# Altium project Ibrahim_Main_Board.PrjPcb (part 1 of 2)
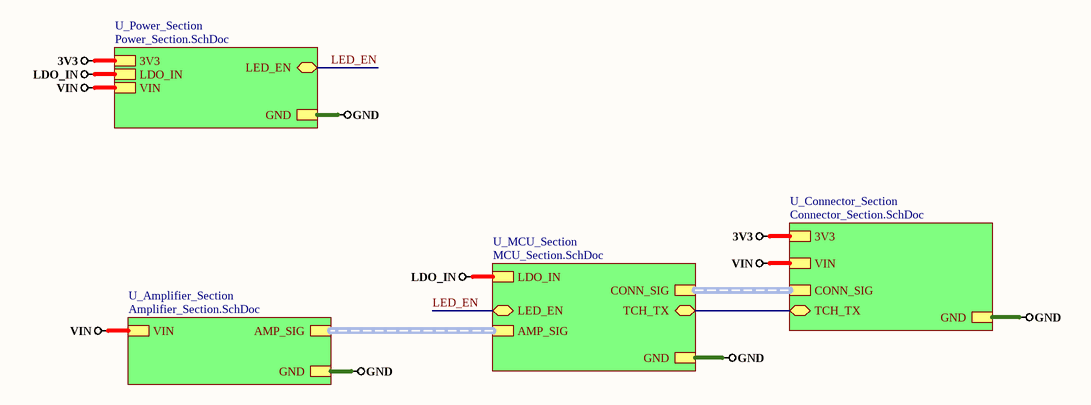
[diagram p0: Top_Sheet.SchDoc]
7 sheets, 83 parts. Net scope: hierarchical (ports join the sheet entries above them; power ports are global).
Board file: Main_PCB.PcbDoc
Sheets:
  Top_Sheet.SchDoc
    U_MCU_Section = MCU_Section.SchDoc
    U_Connector_Section = Connector_Section.SchDoc
    U_Amplifier_Section = Amplifier_Section.SchDoc
    U_Power_Section = Power_Section.SchDoc
      U_MCU_Power_Sheet = MCU_Power_Sheet.SchDoc
      U_LED_Power_Sheet = LED_Power_Sheet.SchDoc

## Sheet Top_Sheet.SchDoc
size A4

### Sub-sheets
U_Amplifier_Section = Amplifier_Section.SchDoc: AMP_SIG (harness AMP_SIG), VIN, GND
U_Connector_Section = Connector_Section.SchDoc: CONN_SIG (harness CONN_SIG), 3V3, GND, VIN, TCH_TX (bidir)
U_MCU_Section = MCU_Section.SchDoc: AMP_SIG (harness AMP_SIG), CONN_SIG (harness CONN_SIG), GND, LDO_IN, LED_EN (bidir), TCH_TX (bidir)
U_Power_Section = Power_Section.SchDoc: 3V3, GND, LDO_IN, VIN, LED_EN (bidir)

### Nets
3V3: sheet U_Connector_Section/3V3, sheet U_Power_Section/3V3
GND: sheet U_MCU_Section/GND, sheet U_Connector_Section/GND, sheet U_Amplifier_Section/GND, sheet U_Power_Section/GND
LDO_IN: sheet U_MCU_Section/LDO_IN, sheet U_Power_Section/LDO_IN
VIN: sheet U_Connector_Section/VIN, sheet U_Amplifier_Section/VIN, sheet U_Power_Section/VIN
LED_EN: sheet U_MCU_Section/LED_EN, sheet U_Power_Section/LED_EN
TCH_TX: sheet U_MCU_Section/TCH_TX, sheet U_Connector_Section/TCH_TX

### Buses and harness runs
harness sheet U_Amplifier_Section/AMP_SIG = sheet U_MCU_Section/AMP_SIG
harness sheet U_Connector_Section/CONN_SIG = sheet U_MCU_Section/CONN_SIG

## Sheet MCU_Section.SchDoc
size A4
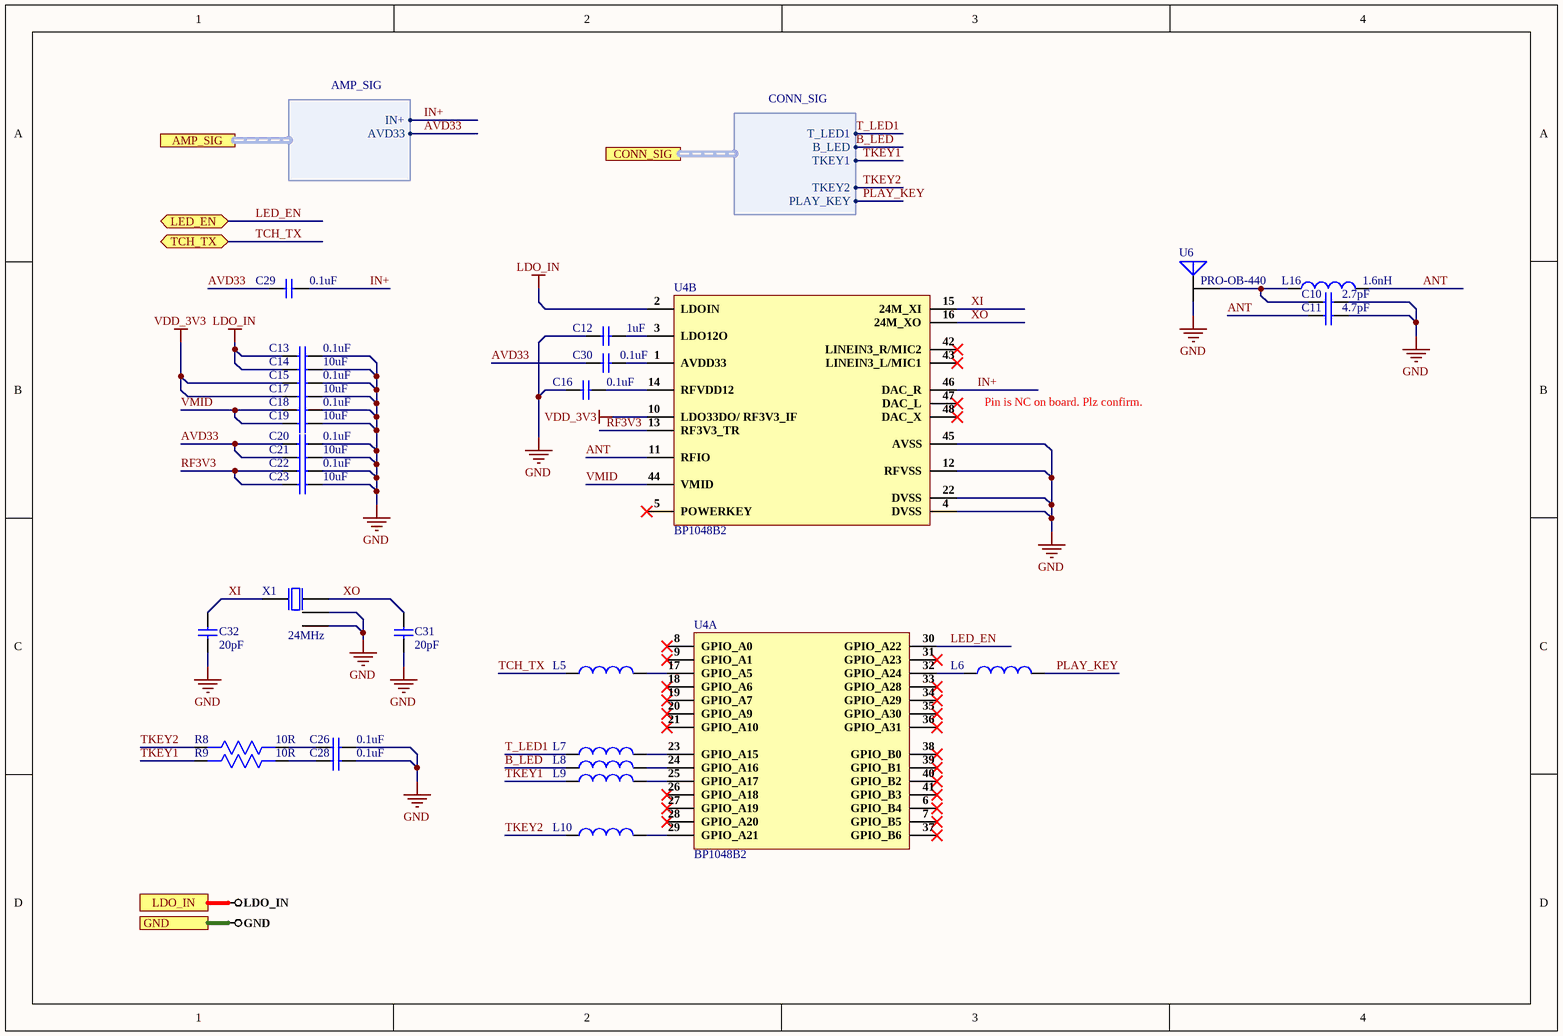
[diagram p1: MCU_Section.SchDoc]

### Parts
C10  2.7pF  [Cap0402]
C11  4.7pF  [Cap0402]
C12  1uF  [Cap0603]
C13  0.1uF  [Cap0805]
C14  10uF  [Cap0603]
C15  0.1uF  [Cap0805]
C16  0.1uF  [Cap0805]
C17  10uF  [Cap0603]
C18  0.1uF  [Cap0805]
C19  10uF  [Cap0603]
C20  0.1uF  [Cap0805]
C21  10uF  [Cap0603]
C22  0.1uF  [Cap0805]
C23  10uF  [Cap0603]
C26  0.1uF  [Cap0805]
C28  0.1uF  [Cap0805]
C29  0.1uF  [Cap0805]
C30  0.1uF  [Cap0805]
C31  20pF  [Cap0805]
C32  20pF  [Cap0805]
L5  BLM18AG121SN1D  [BLM18AG121SN1D]  (value not drawn)
L6  BLM18AG121SN1D  [BLM18AG121SN1D]  (value not drawn)
L7  BLM18AG121SN1D  [BLM18AG121SN1D]  (value not drawn)
L8  BLM18AG121SN1D  [BLM18AG121SN1D]  (value not drawn)
L9  BLM18AG121SN1D  [BLM18AG121SN1D]  (value not drawn)
L10  BLM18AG121SN1D  [BLM18AG121SN1D]  (value not drawn)
L16  1.6nH  [Ind 0402]
R8  10R  [Res0603]
R9  10R  [Res0603]
U4  BP1048B2  [48 LQFP]  (parts A,B of 2)
U6  PRO-OB-440  [PRO-OB-440]
X1  24MHz  [7I24000F20UCG]

### Ports
AMP_SIG (harness AMP_SIG), CONN_SIG (harness CONN_SIG), GND, LDO_IN, LED_EN (bidir), TCH_TX (bidir)

### Harnesses
AMP_SIG: IN+, AVD33
CONN_SIG: T_LED1, B_LED, TKEY1, TKEY2, PLAY_KEY

### Nets
GND: C10.2 C11.2 C12.1 C13.2 C14.2 C15.2 C16.1 C17.2 C18.2 C19.2 C20.2 C21.2 C22.2 C23.2 C26.2 C28.2 C31.1 C32.1 U4.4(DVSS) U4.12(RFVSS) U4.22(DVSS) U4.45(AVSS) U6.1(A) X1.2(GND) X1.4(GND) ; port GND
LDO_IN: C13.1 C14.1 U4.2(LDOIN) ; port LDO_IN
VDD_3V3: C15.1 C17.1 U4.10(LDO33DO/_RF3V3_IF)
ANT: C11.1 L16.2 U4.11(RFIO)
AVD33: C20.1 C21.1 C29.1 C30.1 ; port AMP_SIG.AVD33
B_LED: L8.1 ; port CONN_SIG.B_LED
IN+: C29.2 U4.46(DAC_R) ; port AMP_SIG.IN+
LED_EN: U4.30(GPIO_A22) ; port LED_EN
PLAY_KEY: L6.2 ; port CONN_SIG.PLAY_KEY
RF3V3: C22.1 C23.1 U4.13(RF3V3_TR)
T_LED1: L7.1 ; port CONN_SIG.T_LED1
TCH_TX: L5.1 ; port TCH_TX
TKEY1: L9.1 R9.2 ; port CONN_SIG.TKEY1
TKEY2: L10.1 R8.2 ; port CONN_SIG.TKEY2
VMID: C18.1 C19.1 U4.44(VMID)
XI: C32.2 U4.15(24M_XI) X1.1(inp)
XO: C31.2 U4.16(24M_XO) X1.3(out)
NetC10_1: C10.1 L16.1 U6.2(A)
NetC12_2: C12.2 U4.3(LDO12O)
NetC16_2: C16.2 U4.14(RFVDD12)
NetC26_1: C26.1 R8.1
NetC28_1: C28.1 R9.1
NetC30_2: C30.2 U4.1(AVDD33)
NetL5_2: L5.2 U4.17(GPIO_A5)
NetL6_1: L6.1 U4.32(GPIO_A24)
NetL7_2: L7.2 U4.23(GPIO_A15)
NetL8_2: L8.2 U4.24(GPIO_A16)
NetL9_2: L9.2 U4.25(GPIO_A17)
NetL10_2: L10.2 U4.29(GPIO_A21)

Not connected (* = marked no-connect by the designer): U4 5(POWERKEY)* 6(GPIO_B4)* 7(GPIO_B5)* 8(GPIO_A0)* 9(GPIO_A1)* 18(GPIO_A6)* 19(GPIO_A7)* 20(GPIO_A9)* 21(GPIO_A10)* 26(GPIO_A18)* 27(GPIO_A19)* 28(GPIO_A20)* 31(GPIO_A23)* 33(GPIO_A28)* 34(GPIO_A29)* 35(GPIO_A30)* 36(GPIO_A31)* 37(GPIO_B6)* 38(GPIO_B0)* 39(GPIO_B1)* 40(GPIO_B2)* 41(GPIO_B3)* 42(LINEIN3_R/MIC2)* 43(LINEIN3_L/MIC1)* 47(DAC_L)* 48(DAC_X)*; U6 3(A) 4(A)

### Notes on the sheet
- Pin is NC on board. Plz confirm.

### Library data of the parts
C10 = 04023A2R7BAT2A: CAP CER 2.7PF 25V NP0 0402; Manufacturer: Kyocera AVX; Dielectric: C0G; Temperature Coefficient: 0ppm/°C; Supplier 1: Digi-Key; Manufacturer Part Number: 04023A2R7BAT2A; Stock 1: 28479; Pricing 1: 1=0.32, 10=0.218, 50=0.1452, 100=0.1234, 500=0.08712, 1000=0.07623, 2500=0.0726, 5000=0.06716 (USD); Mount: Surface Mount; Case/Package: 0402; Case Code (Metric): 1005; Case Code (Imperial): 0402; Min Operating Temperature: -55°C; Max Operating Temperature: 125°C; Package Quantity: 10000; Capacitance: 2.7pF; Voltage Rating: 25V; Packaging: Tape and Reel; Voltage Rating (DC): 25V; Termination: SMD/SMT; Length: 1mm; Width: 0.02inch; Thickness: 0.022inch; Depth: 0.5mm; Radiation Hardening: No; Lead Free: Lead Free; ComponentLink1URL: http://datasheets.avx.com/C0GNP0-Dielectric.pdf?src-supplier=Digi-Key; ComponentLink1Description: http://datasheets.avx.com/C0GNP0-Dielectric.pdf?src-supplier=Digi-Key; ComponentLink2URL: http://www.avx.com/docs/Catalogs/ccog.pdf?src-supplier=Future+Electronics; ComponentLink2Description: http://www.avx.com/docs/Catalogs/ccog.pdf?src-supplier=Future+Electronics; ComponentLink3URL: http://www.avxcorp.com/docs/Catalogs/ccog.pdf?src-supplier=Avnet; ComponentLink3Description: http://www.avxcorp.com/docs/Catalogs/ccog.pdf?src-supplier=Avnet; Supplier Part Number 1: 478-12612-6-ND
C11 = 885012005023: CAP CER 4.7PF 16V C0G/NP0 0402; Manufacturer: Wurth Electronics; Supplier 1: Digi-Key; Manufacturer Part Number: 885012005023; Stock 1: 8921; Pricing 1: 1=0.1, 10=0.015, 100=0.0134, 500=0.01188 (USD); Mount: Surface Mount; Case/Package: 0402; Case Code (Metric): 1005; Case Code (Imperial): 0402; Min Operating Temperature: -55°C; Max Operating Temperature: 125°C; Packaging: Cut Tape; Capacitance: 4.7pF; Voltage Rating: 16V; Length: 0.039inch; Width: 0.02inch; Thickness: 0.022inch; ComponentLink1URL: https://katalog.we-online.de/pbs/datasheet/885012005023.pdf?src-supplier=Digi-Key; ComponentLink1Description: https://katalog.we-online.de/pbs/datasheet/885012005023.pdf?src-supplier=Digi-Key; ComponentLink2URL: http://www.farnell.com/datasheets/2546554.pdf?src-supplier=Farnell; ComponentLink2Description: http://www.farnell.com/datasheets/2546554.pdf?src-supplier=Farnell; ComponentLink3URL: http://www.farnell.com/datasheets/2546554.pdf?src-supplier=Newark; ComponentLink3Description: http://www.farnell.com/datasheets/2546554.pdf?src-supplier=Newark; ComponentLink4URL: http://www.farnell.com/datasheets/2546554.pdf?src-supplier=Element14; ComponentLink4Description: http://www.farnell.com/datasheets/2546554.pdf?src-supplier=Element14; Supplier Part Number 1: 732-7439-6-ND
C12 = CC0603KRX5R8BB105: CAP CER 1UF 25V X5R 0603; Manufacturer: Yageo; Tolerance: 10%; Supplier 1: Digi-Key; Manufacturer Part Number: CC0603KRX5R8BB105; RoHS: Yes; Category: Ceramic Capacitors; Stock 1: 919939; Pricing 1: 1=0.12000, 10=0.08400, 50=0.04760, 100=0.03940, 500=0.02764, 1000=0.02288 (USD); Mount: Surface Mount; Case/Package: 0603; Number of Pins: 2; Case Code (Metric): 1608; Case Code (Imperial): 0603; Min Operating Temperature: -55°C; Max Operating Temperature: 85°C; Capacitance: 1uF; Dielectric: X5R; Package Quantity: 1; Voltage Rating: 25V; Packaging: Tape and Reel; Termination: SMD/SMT; Voltage Rating (DC): 25V; Series: CC; Construction: Flat; Length: 1.6mm; Width: 0.031inch; Height: 0.8mm; Thickness: 0.035inch; Depth: 0.8mm; Radiation Hardening: No; REACH SVHC: No SVHC; Lead Free: Lead Free; Halogen Free: Halogen Free; RoHS Compliant: Yes; ComponentLink1URL: https://datasheet.ciiva.com/176/mlccorderingcode-176785.pdf?src-supplier=Digi-Key; ComponentLink1Description: https://datasheet.ciiva.com/176/mlccorderingcode-176785.pdf?src-supplier=Digi-Key; ComponentLink2URL: https://datasheet.ciiva.com/176/mlccorderingcode-176786.pdf?src-supplier=Digi-Key; ComponentLink2Description: https://datasheet.ciiva.com/176/mlccorderingcode-176786.pdf?src-supplier=Digi-Key; ComponentLink3URL: https://datasheet.ciiva.com/176/mlccorderingcode-176787.pdf?src-supplier=Digi-Key; ComponentLink3Description: https://datasheet.ciiva.com/176/mlccorderingcode-176787.pdf?src-supplier=Digi-Key; ComponentLink4URL: https://datasheet.ciiva.com/17436/upy-gphc-x5r-4v-to-50v-12-17436952.pdf?src-supplier=Avnet+Europe; ComponentLink4Description: https://datasheet.ciiva.com/17436/upy-gphc-x5r-4v-to-50v-12-17436952.pdf?src-supplier=Avnet+Europe; ComponentLink5URL: https://datasheet.ciiva.com/7978/1525783-7978171.pdf?src-supplier=Element14; ComponentLink5Description: https://datasheet.ciiva.com/7978/1525783-7978171.pdf?src-supplier=Element14; ComponentLink6URL: https://datasheet.ciiva.com/11586/upy-gphc-x5r-4v-to-50v-12-11586318.pdf?src-supplier=Avnet; ComponentLink6Description: https://datasheet.ciiva.com/11586/upy-gphc-x5r-4v-to-50v-12-11586318.pdf?src-supplier=Avnet; Supplier Part Number 1: 311-1445-1-ND
C13 C15 C16 C18 C20 C22 C26 C28-C30 = 0805B104K500CT: CAP CER 0.1UF 50V X7R 0805; Manufacturer: Walsin Technologies; Tolerance: 10%; Capacitance: 100nF; Supplier 1: Digi-Key; Manufacturer Part Number: 0805B104K500CT; RoHS: Yes; Category: Ceramic Capacitors; Stock 1: 1274242; Pricing 1: 1=0.12000, 10=0.08600, 50=0.04900, 100=0.04050, 500=0.02842, 1000=0.02352 (USD); Case/Package: 0805; Case Code (Imperial): 0805; Case Code (Metric): 2012; Min Operating Temperature: -55°C; Max Operating Temperature: 125°C; Packaging: Tape and Reel; Voltage Rating: 50V; Dielectric: X7R; Voltage Rating (DC): 50V; Voltage: 50V; Length: 2mm; Depth: 1.25mm; Radiation Hardening: No; REACH SVHC: Unknown; Lead Free: Lead Free; ComponentLink1URL: http://www.farnell.com/datasheets/2340522.pdf?src-supplier=Farnell; ComponentLink1Description: http://www.farnell.com/datasheets/2340522.pdf?src-supplier=Farnell; ComponentLink2URL: http://components.arrow.com/part/dataview/0323_00650840?src-supplier=Arrow+Europe; ComponentLink2Description: http://components.arrow.com/part/dataview/0323_00650840?src-supplier=Arrow+Europe; ComponentLink3URL: https://www.verical.com/server-webapp/html/getDatasheet?partID=414849&src-supplier=Verical; ComponentLink3Description: https://www.verical.com/server-webapp/html/getDatasheet?partID=414849&src-supplier=Verical; ComponentLink4URL: http://www.farnell.com/datasheets/2340522.pdf?src-supplier=Element14; ComponentLink4Description: http://www.farnell.com/datasheets/2340522.pdf?src-supplier=Element14; ComponentLink5URL: http://www.passivecomponent.com/wp-content/uploads/2018/10/MLCC.pdf?src-supplier=Digi-Key; ComponentLink5Description: http://www.passivecomponent.com/wp-content/uploads/2018/10/MLCC.pdf?src-supplier=Digi-Key; ComponentLink6URL: http://www.passivecomponent.com/indexsea/0805B104K500CT-IB.pdf?src-supplier=Digi-Key; ComponentLink6Description: http://www.passivecomponent.com/indexsea/0805B104K500CT-IB.pdf?src-supplier=Digi-Key; ComponentLink7URL: http://www.farnell.com/datasheets/2340522.pdf?src-supplier=Newark; ComponentLink7Description: http://www.farnell.com/datasheets/2340522.pdf?src-supplier=Newark; Supplier Part Number 1: 1292-1647-1-ND
C14 C17 C19 C21 C23 = C1608X5R1E106M080AC: CAP CER 10UF 25V X5R 0603; Manufacturer: TDK; Dielectric Material: Ceramic; Tolerance: 20%; Supplier 1: Digi-Key; Manufacturer Part Number: C1608X5R1E106M080AC; RoHS: Yes; Category: Ceramic Capacitors; Stock 1: 217631; Pricing 1: 1=0.86000, 10=0.60700, 50=0.45920, 100=0.39990, 500=0.29624, 1000=0.25180 (USD); Mount: Surface Mount; Case/Package: 0603; Case Code (Imperial): 0603; Case Code (Metric): 1608; Weight: 7.1E-05oz; Min Operating Temperature: -55°C; Max Operating Temperature: 85°C; Capacitance: 10uF; Packaging: Tape and Reel; Voltage Rating: 25V; Voltage Rating (DC): 25V; Termination: SMD/SMT; Series: C; Package Quantity: 1; Dielectric: X5R; Resistor Type: Ceramic; Construction: Flat; Length: 1.6mm; Width: 0.8mm; Height: 0.8mm; Thickness: 0.039inch; Depth: 0.8mm; Lead Free: Lead Free; REACH SVHC: No SVHC; RoHS Compliant: Yes; ComponentLink1URL: http://components.arrow.com/part/dataview/0323_06887183?src-supplier=Arrow+Europe; ComponentLink1Description: http://components.arrow.com/part/dataview/0323_06887183?src-supplier=Arrow+Europe; ComponentLink2URL: http://www.farnell.com/datasheets/2792994.pdf?src-supplier=Farnell; ComponentLink2Description: http://www.farnell.com/datasheets/2792994.pdf?src-supplier=Farnell; ComponentLink3URL: http://www.farnell.com/datasheets/2291921.pdf?src-supplier=Avnet; ComponentLink3Description: http://www.farnell.com/datasheets/2291921.pdf?src-supplier=Avnet; ComponentLink4URL: http://www.farnell.com/datasheets/1470445.pdf?src-supplier=Newark; ComponentLink4Description: http://www.farnell.com/datasheets/1470445.pdf?src-supplier=Newark; ComponentLink5URL: http://www.farnell.com/datasheets/2291921.pdf?src-supplier=Newark; ComponentLink5Description: http://www.farnell.com/datasheets/2291921.pdf?src-supplier=Newark; ComponentLink6URL: http://www.farnell.com/datasheets/2792994.pdf?src-supplier=Element14; ComponentLink6Description: http://www.farnell.com/datasheets/2792994.pdf?src-supplier=Element14; ComponentLink7URL: http://www.farnell.com/datasheets/1913358.pdf?src-supplier=Element14; ComponentLink7Description: http://www.farnell.com/datasheets/1913358.pdf?src-supplier=Element14; ComponentLink8URL: https://product.tdk.com/info/en/catalog/datasheets/mlcc_commercial_general_en.pdf?src-supplier=Digi-Key; ComponentLink8Description: https://product.tdk.com/info/en/catalog/datasheets/mlcc_commercial_general_en.pdf?src-supplier=Digi-Key; ComponentLink9URL: http://www.farnell.com/datasheets/2291921.pdf?src-supplier=RSComponents; ComponentLink9Description: http://www.farnell.com/datasheets/2291921.pdf?src-supplier=RSComponents; ComponentLink10URL: http://www.farnell.com/datasheets/2291921.pdf?src-supplier=Verical; ComponentLink10Description: http://www.farnell.com/datasheets/2291921.pdf?src-supplier=Verical; ComponentLink11URL: http://www.farnell.com/datasheets/2291921.pdf?src-supplier=Mouser; ComponentLink11Description: http://www.farnell.com/datasheets/2291921.pdf?src-supplier=Mouser; ComponentLink12URL: http://www.farnell.com/datasheets/2792994.pdf?src-supplier=Newark; ComponentLink12Description: http://www.farnell.com/datasheets/2792994.pdf?src-supplier=Newark; ComponentLink13URL: http://www.farnell.com/datasheets/2291921.pdf?src-supplier=Quest; ComponentLink13Description: http://www.farnell.com/datasheets/2291921.pdf?src-supplier=Quest; ComponentLink14URL: http://www.farnell.com/datasheets/2291921.pdf?src-supplier=TTI; ComponentLink14Description: http://www.farnell.com/datasheets/2291921.pdf?src-supplier=TTI; Supplier Part Number 1: 445-9015-1-ND
C31 C32 = C0805C200J5GACTU: CAP CER 20PF 50V C0G/NP0 0805; Manufacturer: KEMET; Dielectric Material: Ceramic; Tolerance: 5%; Dielectric: C0G; Dissipation Factor: 0.1%; Supplier 1: Digi-Key; Manufacturer Part Number: C0805C200J5GACTU; RoHS: Yes; Category: Ceramic Capacitors; Stock 1: 17196; Pricing 1: 1=0.30000, 10=0.20700, 50=0.13800, 100=0.11730, 500=0.08280, 1000=0.07245 (USD); Mount: Surface Mount; Case/Package: 0805; Contact Plating: Tin,Matte; Case Code (Imperial): 0805; Case Code (Metric): 2012; Min Operating Temperature: -55°C; Max Operating Temperature: 125°C; Capacitance: 20pF; Packaging: Tape and Reel; Voltage Rating (DC): 50V; Series: SMD Comm C0G; Voltage Rating: 50V; Package Quantity: 4000; Termination: SMD/SMT; Construction: Flat; Length: 2mm; Width: 1.2mm; Height: 0.78mm; Depth: 1.25mm; Lead Pitch: 0.75mm; Thickness: 0.035inch; Radiation Hardening: No; Lead Free: Lead Free; REACH SVHC: No SVHC; RoHS Compliant: Yes; ComponentLink1URL: https://datasheet.ciiva.com/5414/kem-c1003-c0g-smd-356956-5414200.pdf?src-supplier=Mouser; ComponentLink1Description: https://datasheet.ciiva.com/5414/kem-c1003-c0g-smd-356956-5414200.pdf?src-supplier=Mouser; Supplier Part Number 1: 399-8033-1-ND
L5-L10 = BLM18AG121SN1D: Ferrite Beads 120Ohm 25% 500mA 0603; Manufacturer: Murata; Material: Steel,Ferrite; Impedance: 120R; DC Resistance (DCR): 180mR; Test Frequency: 100MHz; Number of Lines: 1; Shielding: Unshielded; Supplier 1: Digi-Key; Manufacturer Part Number: BLM18AG121SN1D; RoHS: Yes; Category: Inductors; Stock 1: 1660; Pricing 1: 1=0.10000, 10=0.07900, 25=0.07200, 50=0.06480, 100=0.04760, 250=0.03460, 500=0.03170, 1000=0.02738 (USD); Case/Package: 0603; Number of Pins: 2; Core Material: Ferrite; Case Code (Metric): 1608; Case Code (Imperial): 0603; Min Operating Temperature: -55°C; Max Operating Temperature: 125°C; Tolerance: 25%; Max DC Current: 500mA; Package Quantity: 1; Max Current Rating: 500mA; Packaging: Tape and Reel; Current Rating: 500mA; Termination: SMD/SMT; DC Current: 500mA; Frequency: 100MHz; Number of Circuits: 1; Series: BLM18A; DC Resistance-Max: 180mR; Length: 1.6mm; Width: 0.8mm; Height: 0.8mm; Depth: 0.8mm; Radiation Hardening: No; REACH SVHC: No SVHC; Military Standard: Not; Lead Free: Lead Free; RoHS Compliant: Yes; ComponentLink1URL: https://datasheet.ciiva.com/11795/0900766b811b5866-11795382.pdf?src-supplier=RSComponents; ComponentLink1Description: https://datasheet.ciiva.com/11795/0900766b811b5866-11795382.pdf?src-supplier=RSComponents; ComponentLink2URL: https://datasheet.ciiva.com/19460/1844723-19460204.pdf?src-supplier=Jameco; ComponentLink2Description: https://datasheet.ciiva.com/19460/1844723-19460204.pdf?src-supplier=Jameco; ComponentLink3URL: https://datasheet.ciiva.com/29347/442268-da-01-en-chip-drossel-0603-120r-500ma-1-6x0-8mm-29347890.pdf?src-supplier=Conrad; ComponentLink3Description: https://datasheet.ciiva.com/29347/442268-da-01-en-chip-drossel-0603-120r-500ma-1-6x0-8mm-29347890.pdf?src-supplier=Conrad; ComponentLink4URL: https://datasheet.ciiva.com/41449/001172222-da-01-en-drossel-0603-120r-1-6x0-8mm-4000st-41449509.pdf?src-supplier=Conrad; ComponentLink4Description: https://datasheet.ciiva.com/41449/001172222-da-01-en-drossel-0603-120r-1-6x0-8mm-4000st-41449509.pdf?src-supplier=Conrad; ComponentLink5URL: https://datasheet.ciiva.com/14122/blm-series-eng-tds-14122902.pdf?src-supplier=Distrelec; ComponentLink5Description: https://datasheet.ciiva.com/14122/blm-series-eng-tds-14122902.pdf?src-supplier=Distrelec; ComponentLink6URL: https://datasheet.ciiva.com/17246/l0110s0100blm18a-17246919.pdf?src-supplier=Avnet+Europe; ComponentLink6Description: https://datasheet.ciiva.com/17246/l0110s0100blm18a-17246919.pdf?src-supplier=Avnet+Europe; ComponentLink7URL: https://datasheet.ciiva.com/3081/l0110s0100blm18a-3081610.pdf?src-supplier=Avnet; ComponentLink7Description: https://datasheet.ciiva.com/3081/l0110s0100blm18a-3081610.pdf?src-supplier=Avnet; ComponentLink8URL: https://datasheet.ciiva.com/1012/l0110s0100blm18a-1012011.pdf?src-supplier=Digi-Key; ComponentLink8Description: https://datasheet.ciiva.com/1012/l0110s0100blm18a-1012011.pdf?src-supplier=Digi-Key; ComponentLink9URL: https://datasheet.ciiva.com/1012/l0110s0100blm18a-1012012.pdf?src-supplier=Digi-Key; ComponentLink9Description: https://datasheet.ciiva.com/1012/l0110s0100blm18a-1012012.pdf?src-supplier=Digi-Key; ComponentLink10URL: https://datasheet.ciiva.com/8510/l0110s0100blm18a-8510156.pdf?src-supplier=Avnet; ComponentLink10Description: https://datasheet.ciiva.com/8510/l0110s0100blm18a-8510156.pdf?src-supplier=Avnet; ComponentLink11URL: https://datasheet.ciiva.com/1012/l0110s0100blm18a-1012013.pdf?src-supplier=Digi-Key; ComponentLink11Description: https://datasheet.ciiva.com/1012/l0110s0100blm18a-1012013.pdf?src-supplier=Digi-Key; ComponentLink12URL: https://datasheet.ciiva.com/16215/l0110s0100blm18a-16215230.pdf?src-supplier=Future+Electronics; ComponentLink12Description: https://datasheet.ciiva.com/16215/l0110s0100blm18a-16215230.pdf?src-supplier=Future+Electronics; Supplier Part Number 1: 490-1011-1-ND
L16 = HLC021R6BTTR: FIXED IND 1.6NH 660MA 150 MOHM; Manufacturer: Kyocera AVX; Core Material: Non-Magnetic; DC Resistance (DCR): 150mR; Shielding: Unshielded; Self Resonant Frequency: 18GHz; Test Frequency: 450MHz; Q Factor: 25; Supplier 1: Digi-Key; Manufacturer Part Number: HLC021R6BTTR; Stock 1: 5000; Pricing 1: 1=0.41, 10=0.36, 25=0.3152, 50=0.2704, 100=0.2478, 250=0.22524, 500=0.21174, 1000=0.16218, 2500=0.15317 (USD); Mount: Surface Mount; Case/Package: 0402; Case Code (Metric): 1005; Case Code (Imperial): 0402; Min Operating Temperature: -55°C; Max Operating Temperature: 125°C; Inductance: 1.6nH; Max DC Current: 660mA; Packaging: Tape and Reel; Package Quantity: 5000; Current Rating: 660mA; Termination: SMD/SMT; Length: 1mm; Height: 0.35mm; Depth: 0.66mm; Width: 0.023inch; Height - Seated (Max): 0.018inch; Radiation Hardening: No; REACH SVHC: No SVHC; Lead Free: Lead Free; ComponentLink1URL: https://media.digikey.com/pdf/Data%20Sheets/AVX%20PDFs/MLO%20High%20Current%20Inductors.pdf?src-supplier=Digi-Key; ComponentLink1Description: https://media.digikey.com/pdf/Data%20Sheets/AVX%20PDFs/MLO%20High%20Current%20Inductors.pdf?src-supplier=Digi-Key; ComponentLink2URL: http://www.avx.com/docs/catalogs/mlohighcurrentinductor.pdf?src-supplier=Future+Electronics; ComponentLink2Description: http://www.avx.com/docs/catalogs/mlohighcurrentinductor.pdf?src-supplier=Future+Electronics; Supplier Part Number 1: 478-HLC021R6BTCT-ND
R8 R9 = RC0603JR-0710RL: RES SMD 10R 0.1W 0603; Manufacturer: Yageo; Tolerance: 5%; Temperature Coefficient: 200ppm/°C; Voltage Rating (DC): 50V; Power Rating: 100mW; Supplier 1: Digi-Key; Manufacturer Part Number: RC0603JR-0710RL; RoHS: Yes; Category: Chip SMD Resistors; Stock 1: 1146672; Pricing 1: 1=0.10000, 10=0.04000, 100=0.01620, 1000=0.00728, 2500=0.00632 (USD); Case/Package: 0603; Number of Pins: 2; Case Code (Imperial): 0603; Case Code (Metric): 1608; Size Code: 0603; Min Operating Temperature: -55°C; Max Operating Temperature: 155°C; Resistance: 10R; Resistor Type: Thick Film; Packaging: Tape and Reel; Voltage Rating: 50V; Termination: SMD/SMT; Features: Moisture Resistant; Series: RC; Max Power Dissipation: 100mW; Number of Terminations: 2; Construction: Rectangular; Resistance Tolerance: 5%; Length: 1.6mm; Width: 0.8mm; Depth: 0.8mm; REACH SVHC: No SVHC; Lead Free: Lead Free; Military Standard: Not; RoHS Compliant: Yes; ComponentLink1URL: https://datasheet.ciiva.com/46395/443971-46395069.pdf?src-supplier=Element14; ComponentLink1Description: https://datasheet.ciiva.com/46395/443971-46395069.pdf?src-supplier=Element14; ComponentLink2URL: https://datasheet.ciiva.com/7746/443971-7746431.pdf?src-supplier=Element14; ComponentLink2Description: https://datasheet.ciiva.com/7746/443971-7746431.pdf?src-supplier=Element14; Supplier Part Number 1: 311-10GRCT-ND
U4 = BP1048B2: High Performance 32-bit Bluetooth Audio P; Manufacturer: MV Silicon; Pitch: 0.5mm; Package: LQFP48
U6 = PRO-OB-440: RF ANT 2.4GHZ STAMPED MET SLD; Manufacturer: Proant; Number of Bands: 1; Return Loss: -10dB; Supplier 1: Digi-Key; Manufacturer Part Number: PRO-OB-440; Stock 1: 23502; Pricing 1: 1=0.74, 10=0.647, 25=0.608, 100=0.4964, 250=0.46104, 500=0.39238 (USD); Mount: Surface Mount; Packaging: Cut Tape; Termination: Solder; ComponentLink1URL: https://media.digikey.com/pdf/Data%20Sheets/Proant%20PDF's/PRO-OB-440_Dwg.PDF?src-supplier=Digi-Key; ComponentLink1Description: https://media.digikey.com/pdf/Data%20Sheets/Proant%20PDF's/PRO-OB-440_Dwg.PDF?src-supplier=Digi-Key; ComponentLink2URL: http://www.proant.se/files/user/Application%20note%20-%20OnBoard%20SMD%20GNSS%20rev%202.0.pdf?src-supplier=Digi-Key; ComponentLink2Description: http://www.proant.se/files/user/Application%20note%20-%20OnBoard%20SMD%20GNSS%20rev%202.0.pdf?src-supplier=Digi-Key; ComponentLink3URL: http://www.proant.se/files/user/Documents/Datasheet%20-%20OnBoard%20SMD%202400%20MHz%20rev%203.pdf?src-supplier=Digi-Key; ComponentLink3Description: http://www.proant.se/files/user/Documents/Datasheet%20-%20OnBoard%20SMD%202400%20MHz%20rev%203.pdf?src-supplier=Digi-Key; Supplier Part Number 1: 1532-1001-6-ND
X1 = 7I24000F20UCG: 24MHz ±20ppm 20pF 40Ω SMD-5032_4P Crystals RoHS; Manufacturer: SJK(SHENZHEN CRYSTAL TECH); Crystal Type: Passive SMD Crystal; Package: SMD-5032_4P; Frequency: 24MHz; Frequency Tolerance: ±20ppm; Load Capacitance: 20pF; ESR (Equivalent Series Resistance): 40Ω; Operating Temperature: -40℃~+85℃

## Sheet Connector_Section.SchDoc
size A4
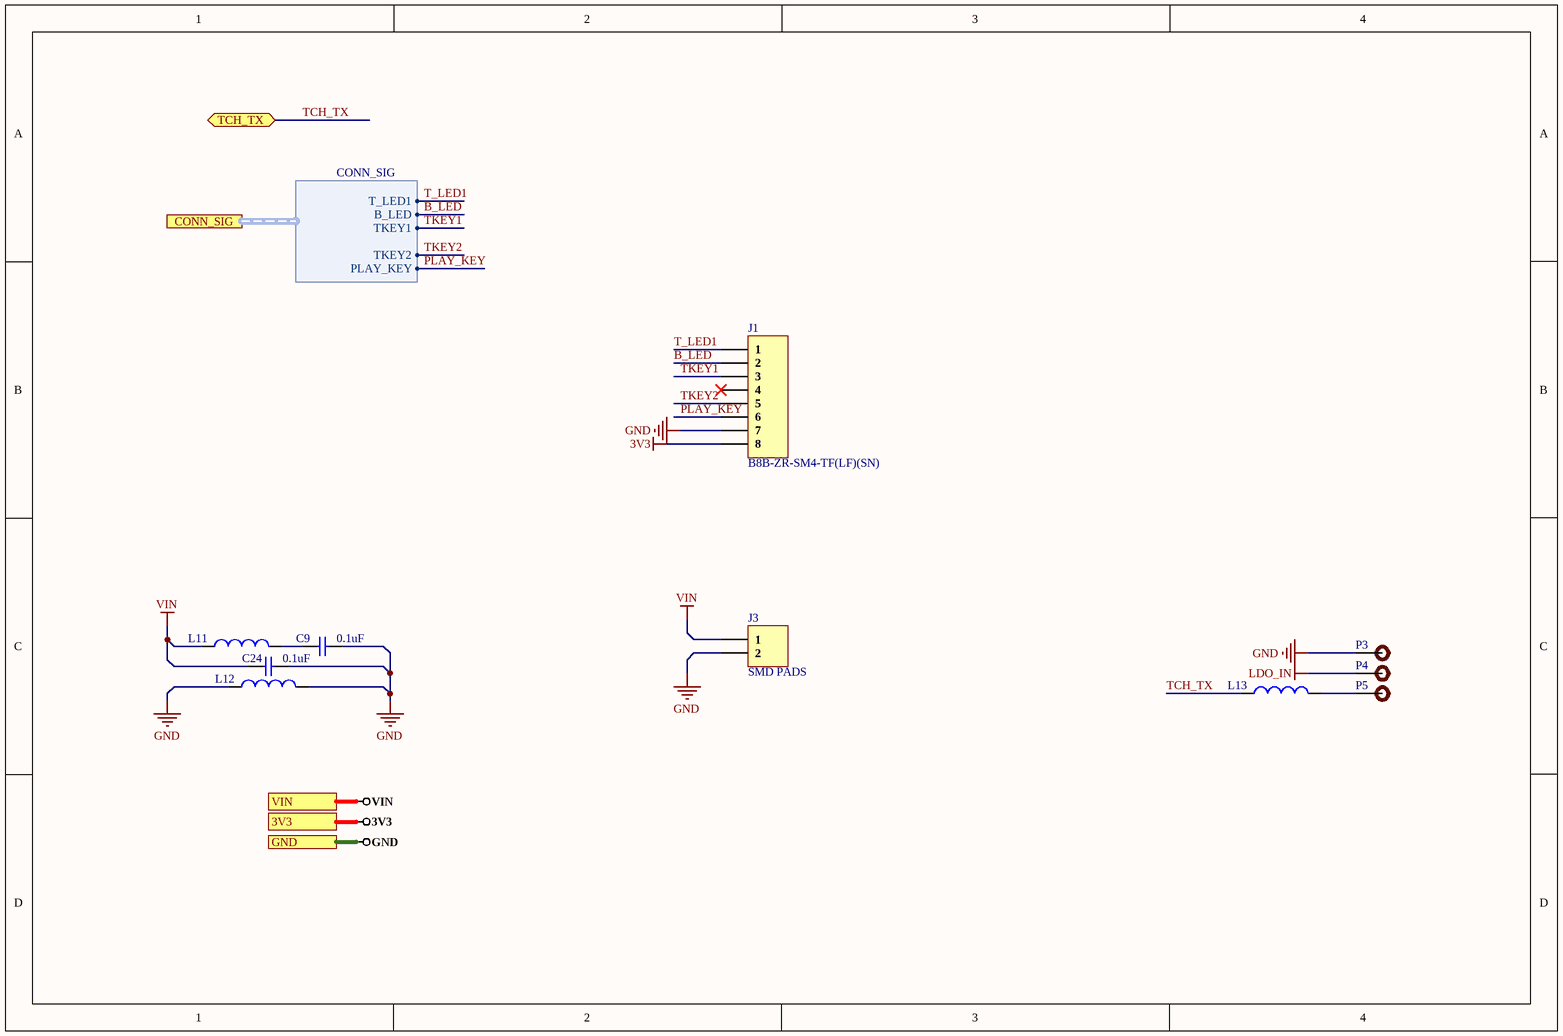
[diagram p2: Connector_Section.SchDoc]

### Parts
C9  0.1uF  [Cap0805]
C24  0.1uF  [Cap0805]
J1  B8B-ZR-SM4-TF(LF)(SN)  [B8B-ZR-SM4-TF(LF)(SN)]
J3  SMD PADS  [SMD PAD]
L11  BLM18AG121SN1D  [BLM18AG121SN1D]  (value not drawn)
L12  BLM18AG121SN1D  [BLM18AG121SN1D]  (value not drawn)
L13  BLM18AG121SN1D  [BLM18AG121SN1D]  (value not drawn)
P3  Test Point  [TEST POINT]  (value not drawn)
P4  Test Point  [TEST POINT]  (value not drawn)
P5  Test Point  [TEST POINT]  (value not drawn)

### Ports
3V3, CONN_SIG (harness CONN_SIG), GND, TCH_TX (bidir), VIN

### Harnesses
CONN_SIG: T_LED1, B_LED, TKEY1, TKEY2, PLAY_KEY

### Nets
3V3: J1.8 ; port 3V3
GND: C9.2 C24.2 J1.7 J3.2 L12.1 L12.2 P3.1 ; port GND
LDO_IN: P4.1
VIN: C24.1 J3.1 L11.1 ; port VIN
B_LED: J1.2 ; port CONN_SIG.B_LED
PLAY_KEY: J1.6 ; port CONN_SIG.PLAY_KEY
T_LED1: J1.1 ; port CONN_SIG.T_LED1
TCH_TX: L13.1 ; port TCH_TX
TKEY1: J1.3 ; port CONN_SIG.TKEY1
TKEY2: J1.5 ; port CONN_SIG.TKEY2
NetC9_1: C9.1 L11.2
NetL13_2: L13.2 P5.1

Not connected (* = marked no-connect by the designer): J1 4*

### Library data of the parts
C9 C24 = 0805B104K500CT: as C13 on sheet MCU_Section; Supplier 1: Digi-Key; Manufacturer Part Number: 0805B104K500CT; RoHS: Yes; Category: Ceramic Capacitors; Stock 1: 1274242; Pricing 1: 1=0.12000, 10=0.08600, 50=0.04900, 100=0.04050, 500=0.02842, 1000=0.02352 (USD); Case/Package: 0805; Case Code (Imperial): 0805; Case Code (Metric): 2012; Min Operating Temperature: -55°C; Max Operating Temperature: 125°C; Packaging: Tape and Reel; Voltage Rating: 50V; Dielectric: X7R; Voltage Rating (DC): 50V; Voltage: 50V; Length: 2mm; Depth: 1.25mm; Radiation Hardening: No; REACH SVHC: Unknown; Lead Free: Lead Free; ComponentLink1URL: http://www.farnell.com/datasheets/2340522.pdf?src-supplier=Farnell; ComponentLink1Description: http://www.farnell.com/datasheets/2340522.pdf?src-supplier=Farnell; ComponentLink2URL: http://components.arrow.com/part/dataview/0323_00650840?src-supplier=Arrow+Europe; ComponentLink2Description: http://components.arrow.com/part/dataview/0323_00650840?src-supplier=Arrow+Europe; ComponentLink3URL: https://www.verical.com/server-webapp/html/getDatasheet?partID=414849&src-supplier=Verical; ComponentLink3Description: https://www.verical.com/server-webapp/html/getDatasheet?partID=414849&src-supplier=Verical; ComponentLink4URL: http://www.farnell.com/datasheets/2340522.pdf?src-supplier=Element14; ComponentLink4Description: http://www.farnell.com/datasheets/2340522.pdf?src-supplier=Element14; ComponentLink5URL: http://www.passivecomponent.com/wp-content/uploads/2018/10/MLCC.pdf?src-supplier=Digi-Key; ComponentLink5Description: http://www.passivecomponent.com/wp-content/uploads/2018/10/MLCC.pdf?src-supplier=Digi-Key; ComponentLink6URL: http://www.passivecomponent.com/indexsea/0805B104K500CT-IB.pdf?src-supplier=Digi-Key; ComponentLink6Description: http://www.passivecomponent.com/indexsea/0805B104K500CT-IB.pdf?src-supplier=Digi-Key; ComponentLink7URL: http://www.farnell.com/datasheets/2340522.pdf?src-supplier=Newark; ComponentLink7Description: http://www.farnell.com/datasheets/2340522.pdf?src-supplier=Newark; Supplier Part Number 1: 1292-1647-1-ND
J1 = B8B-ZR-SM4-TF(LF)(SN): Conn Shrouded Header HDR 8 POS 1.5mm Solder ST SMD T/R; Manufacturer: JST; Number of Positions: 8; Connector Type: Male Pin; Current Rating: 1A; Gender: Male; Contact Resistance: 30mR; Max Voltage Rating (AC): 50V; Supplier 1: Digi-Key; Manufacturer Part Number: B8B-ZR-SM4-TF(LF)(SN); RoHS: Yes; Category: Board to Board Connectors; Pricing 1: 1=0.80000, 10=0.70700, 100=0.60970, 500=0.49886 (USD); Mount: Surface Mount; Contact Plating: Tin,Copper; Contact Material: Tin,Brass; Color: Natural; Housing Color: Beige; Housing Material: Polyamide; Min Operating Temperature: -25°C; Max Operating Temperature: 85°C; Number of Rows: 1; Packaging: Tape and Reel; Termination: Solder; Number of Contacts: 8; Max Current Rating: 1A; Fastening Type: Detent; Orientation: Right Angle; Length: 15mm; Width: 3.5mm; Height: 7.2mm; Pitch: 1.5mm; Depth: 6.5mm; Lead Free: Lead Free; ComponentLink1URL: https://datasheet.ciiva.com/26894/getdatasheetpartid-640747-26894507.pdf?src-supplier=Verical; ComponentLink1Description: https://datasheet.ciiva.com/26894/getdatasheetpartid-640747-26894507.pdf?src-supplier=Verical; ComponentLink2URL: https://datasheet.ciiva.com/16418/ezr-16418253.pdf?src-supplier=Future+Electronics; ComponentLink2Description: https://datasheet.ciiva.com/16418/ezr-16418253.pdf?src-supplier=Future+Electronics; Supplier Part Number 1: 455-1687-1-ND
J3 = SMD PAD
L11-L13 = BLM18AG121SN1D: as L5 on sheet MCU_Section; Supplier 1: Digi-Key; Manufacturer Part Number: BLM18AG121SN1D; RoHS: Yes; Category: Inductors; Stock 1: 1660; Pricing 1: 1=0.10000, 10=0.07900, 25=0.07200, 50=0.06480, 100=0.04760, 250=0.03460, 500=0.03170, 1000=0.02738 (USD); Case/Package: 0603; Number of Pins: 2; Core Material: Ferrite; Case Code (Metric): 1608; Case Code (Imperial): 0603; Min Operating Temperature: -55°C; Max Operating Temperature: 125°C; Tolerance: 25%; Max DC Current: 500mA; Package Quantity: 1; Max Current Rating: 500mA; Packaging: Tape and Reel; Current Rating: 500mA; Termination: SMD/SMT; DC Current: 500mA; Frequency: 100MHz; Number of Circuits: 1; Series: BLM18A; DC Resistance-Max: 180mR; Length: 1.6mm; Width: 0.8mm; Height: 0.8mm; Depth: 0.8mm; Radiation Hardening: No; REACH SVHC: No SVHC; Military Standard: Not; Lead Free: Lead Free; RoHS Compliant: Yes; ComponentLink1URL: https://datasheet.ciiva.com/11795/0900766b811b5866-11795382.pdf?src-supplier=RSComponents; ComponentLink1Description: https://datasheet.ciiva.com/11795/0900766b811b5866-11795382.pdf?src-supplier=RSComponents; ComponentLink2URL: https://datasheet.ciiva.com/19460/1844723-19460204.pdf?src-supplier=Jameco; ComponentLink2Description: https://datasheet.ciiva.com/19460/1844723-19460204.pdf?src-supplier=Jameco; ComponentLink3URL: https://datasheet.ciiva.com/29347/442268-da-01-en-chip-drossel-0603-120r-500ma-1-6x0-8mm-29347890.pdf?src-supplier=Conrad; ComponentLink3Description: https://datasheet.ciiva.com/29347/442268-da-01-en-chip-drossel-0603-120r-500ma-1-6x0-8mm-29347890.pdf?src-supplier=Conrad; ComponentLink4URL: https://datasheet.ciiva.com/41449/001172222-da-01-en-drossel-0603-120r-1-6x0-8mm-4000st-41449509.pdf?src-supplier=Conrad; ComponentLink4Description: https://datasheet.ciiva.com/41449/001172222-da-01-en-drossel-0603-120r-1-6x0-8mm-4000st-41449509.pdf?src-supplier=Conrad; ComponentLink5URL: https://datasheet.ciiva.com/14122/blm-series-eng-tds-14122902.pdf?src-supplier=Distrelec; ComponentLink5Description: https://datasheet.ciiva.com/14122/blm-series-eng-tds-14122902.pdf?src-supplier=Distrelec; ComponentLink6URL: https://datasheet.ciiva.com/17246/l0110s0100blm18a-17246919.pdf?src-supplier=Avnet+Europe; ComponentLink6Description: https://datasheet.ciiva.com/17246/l0110s0100blm18a-17246919.pdf?src-supplier=Avnet+Europe; ComponentLink7URL: https://datasheet.ciiva.com/3081/l0110s0100blm18a-3081610.pdf?src-supplier=Avnet; ComponentLink7Description: https://datasheet.ciiva.com/3081/l0110s0100blm18a-3081610.pdf?src-supplier=Avnet; ComponentLink8URL: https://datasheet.ciiva.com/1012/l0110s0100blm18a-1012011.pdf?src-supplier=Digi-Key; ComponentLink8Description: https://datasheet.ciiva.com/1012/l0110s0100blm18a-1012011.pdf?src-supplier=Digi-Key; ComponentLink9URL: https://datasheet.ciiva.com/1012/l0110s0100blm18a-1012012.pdf?src-supplier=Digi-Key; ComponentLink9Description: https://datasheet.ciiva.com/1012/l0110s0100blm18a-1012012.pdf?src-supplier=Digi-Key; ComponentLink10URL: https://datasheet.ciiva.com/8510/l0110s0100blm18a-8510156.pdf?src-supplier=Avnet; ComponentLink10Description: https://datasheet.ciiva.com/8510/l0110s0100blm18a-8510156.pdf?src-supplier=Avnet; ComponentLink11URL: https://datasheet.ciiva.com/1012/l0110s0100blm18a-1012013.pdf?src-supplier=Digi-Key; ComponentLink11Description: https://datasheet.ciiva.com/1012/l0110s0100blm18a-1012013.pdf?src-supplier=Digi-Key; ComponentLink12URL: https://datasheet.ciiva.com/16215/l0110s0100blm18a-16215230.pdf?src-supplier=Future+Electronics; ComponentLink12Description: https://datasheet.ciiva.com/16215/l0110s0100blm18a-16215230.pdf?src-supplier=Future+Electronics; Supplier Part Number 1: 490-1011-1-ND
P3-P5 = TEST POINT: Test Point ON

## Sheet Amplifier_Section.SchDoc
size A4
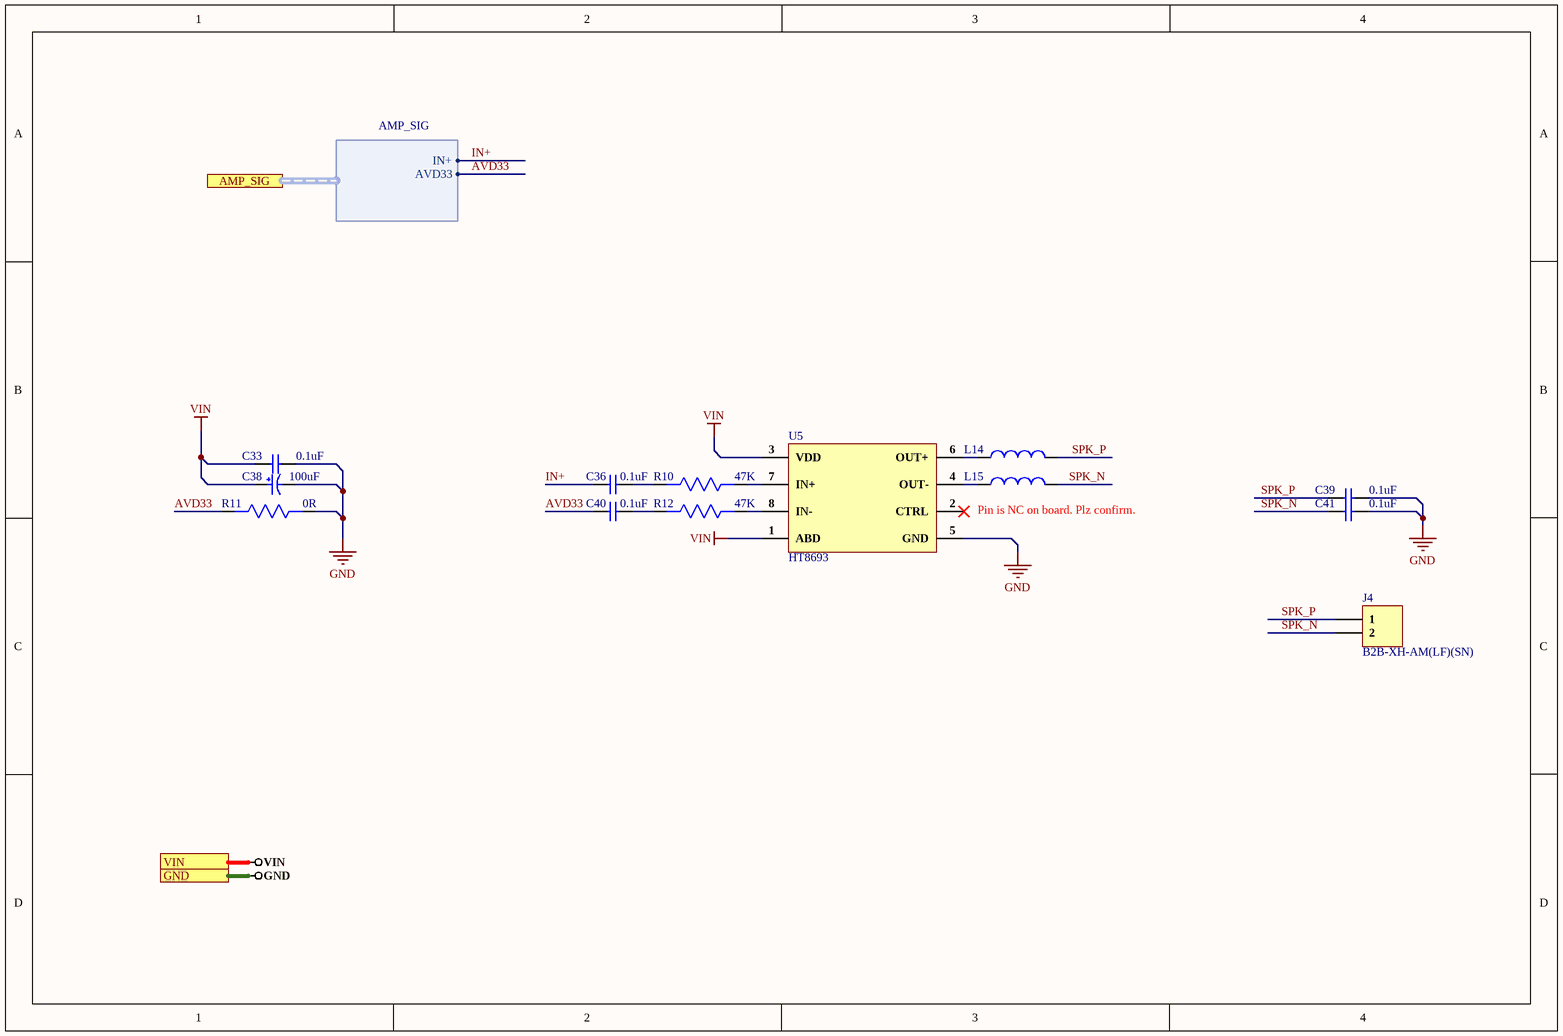
[diagram p3: Amplifier_Section.SchDoc]

### Parts
C33  0.1uF  [CAP 0201]
C36  0.1uF  [Cap0805]
C38  100uF  [RVT1A101M0505]
C39  0.1uF  [Cap0805]
C40  0.1uF  [Cap0805]
C41  0.1uF  [Cap0805]
J4  B2B-XH-AM(LF)(SN)  [B2B-XH-AM(LF)(SN)]
L14  BLM18AG121SN1D  [BLM18AG121SN1D]  (value not drawn)
L15  BLM18AG121SN1D  [BLM18AG121SN1D]  (value not drawn)
R10  47K  [Res0603]
R11  0R  [RES 0805]
R12  47K  [Res0603]
U5  HT8693  [SOP-8]

### Ports
AMP_SIG (harness AMP_SIG), GND, VIN

### Harnesses
AMP_SIG: IN+, AVD33

### Nets
GND: C33.2 C38.2 C39.2 C41.2 R11.1 U5.5(GND) ; port GND
VIN: C33.1 C38.1 U5.1(ABD) U5.3(VDD) ; port VIN
AVD33: C40.1 R11.2 ; port AMP_SIG.AVD33
IN+: C36.1 ; port AMP_SIG.IN+
SPK_N: C41.1 J4.2 L15.2
SPK_P: C39.1 J4.1 L14.2
NetC36_2: C36.2 R10.2
NetC40_2: C40.2 R12.2
NetL14_1: L14.1 U5.6(OUT+)
NetL15_1: L15.1 U5.4(OUT-)
NetR10_1: R10.1 U5.7(IN+)
NetR12_1: R12.1 U5.8(IN-)

Not connected (* = marked no-connect by the designer): U5 2(CTRL)*

### Notes on the sheet
- (near L15) Pin is NC on board. Plz confirm.

### Library data of the parts
C33 = GRM033R6YA104ME14D: CAP CER 0.1UF 35V X5R 0201; Manufacturer: Murata; Tolerance: 20%; Capacitance: 100nF; Supplier 1: Digi-Key; Manufacturer Part Number: GRM033R6YA104ME14D; RoHS: Yes; Category: Ceramic Capacitors; Stock 1: 49800; Pricing 1: 1=0.10000, 10=0.05600, 50=0.03040, 100=0.02490, 500=0.01778, 1000=0.01398, 2500=0.01270, 5000=0.01169 (USD); Mount: Surface Mount; Case/Package: 0201; Weight: 1.2E-05oz; Case Code (Metric): 0603; Case Code (Imperial): 0201; Min Operating Temperature: -55°C; Max Operating Temperature: 85°C; Dielectric: X5R; Termination: SMD/SMT; Voltage Rating (DC): 35V; Package Quantity: 15000; Packaging: Tape and Reel; Voltage Rating: 35V; Length: 0.024inch; Height: 0.3mm; Width: 0.012inch; Thickness: 0.013inch; ComponentLink1URL: http://www.mouser.com/ds/2/281/c02e-2905.pdf?src-supplier=Mouser; ComponentLink1Description: http://www.mouser.com/ds/2/281/c02e-2905.pdf?src-supplier=Mouser; ComponentLink2URL: http://search.murata.co.jp/Ceramy/image/img/A01X/G101/ENG/GRM033R6YA104ME14-01.pdf?src-supplier=Digi-Key; ComponentLink2Description: http://search.murata.co.jp/Ceramy/image/img/A01X/G101/ENG/GRM033R6YA104ME14-01.pdf?src-supplier=Digi-Key; Supplier Part Number 1: 490-10431-1-ND
C36 C39-C41 = 0805B104K500CT: as C13 on sheet MCU_Section; Supplier 1: Digi-Key; Manufacturer Part Number: 0805B104K500CT; RoHS: Yes; Category: Ceramic Capacitors; Stock 1: 1274242; Pricing 1: 1=0.12000, 10=0.08600, 50=0.04900, 100=0.04050, 500=0.02842, 1000=0.02352 (USD); Case/Package: 0805; Case Code (Imperial): 0805; Case Code (Metric): 2012; Min Operating Temperature: -55°C; Max Operating Temperature: 125°C; Packaging: Tape and Reel; Voltage Rating: 50V; Dielectric: X7R; Voltage Rating (DC): 50V; Voltage: 50V; Length: 2mm; Depth: 1.25mm; Radiation Hardening: No; REACH SVHC: Unknown; Lead Free: Lead Free; ComponentLink1URL: http://www.farnell.com/datasheets/2340522.pdf?src-supplier=Farnell; ComponentLink1Description: http://www.farnell.com/datasheets/2340522.pdf?src-supplier=Farnell; ComponentLink2URL: http://components.arrow.com/part/dataview/0323_00650840?src-supplier=Arrow+Europe; ComponentLink2Description: http://components.arrow.com/part/dataview/0323_00650840?src-supplier=Arrow+Europe; ComponentLink3URL: https://www.verical.com/server-webapp/html/getDatasheet?partID=414849&src-supplier=Verical; ComponentLink3Description: https://www.verical.com/server-webapp/html/getDatasheet?partID=414849&src-supplier=Verical; ComponentLink4URL: http://www.farnell.com/datasheets/2340522.pdf?src-supplier=Element14; ComponentLink4Description: http://www.farnell.com/datasheets/2340522.pdf?src-supplier=Element14; ComponentLink5URL: http://www.passivecomponent.com/wp-content/uploads/2018/10/MLCC.pdf?src-supplier=Digi-Key; ComponentLink5Description: http://www.passivecomponent.com/wp-content/uploads/2018/10/MLCC.pdf?src-supplier=Digi-Key; ComponentLink6URL: http://www.passivecomponent.com/indexsea/0805B104K500CT-IB.pdf?src-supplier=Digi-Key; ComponentLink6Description: http://www.passivecomponent.com/indexsea/0805B104K500CT-IB.pdf?src-supplier=Digi-Key; ComponentLink7URL: http://www.farnell.com/datasheets/2340522.pdf?src-supplier=Newark; ComponentLink7Description: http://www.farnell.com/datasheets/2340522.pdf?src-supplier=Newark; Supplier Part Number 1: 1292-1647-1-ND
C38 = RVT1A101M0505: 100uF ±20% 10V 5mm 5.4mm 2000hrs 105℃ -45℃~+105℃ SMD,5x5.4mm Aluminum Electrolytic Capacitors - SMD RoHS; Manufacturer: CX(Dongguan Chengxing Elec); Package: SMD,5x5.4mm; Capacitance: 100uF; Tolerance: ±20%; Rated Voltage: 10V; φD: 5mm; L: 5.4mm; Operating Temperature: -45℃~+105℃
J4 = B2B-XH-AM(LF)(SN): XH Header Male Pin 0.098"(2.50mm) 2 Through Hole,P=2.5mm Wire To Board / Wire To Wire Connector RoHS; Manufacturer: JST Sales America; Number of Positions: 2; Series: XH; Connector Type: Header; Contact Type: Male Pin; Pitch: 0.098"(2.50mm); Number of Rows: 1
L14 L15 = BLM18AG121SN1D: as L5 on sheet MCU_Section; Supplier 1: Digi-Key; Manufacturer Part Number: BLM18AG121SN1D; RoHS: Yes; Category: Inductors; Stock 1: 1660; Pricing 1: 1=0.10000, 10=0.07900, 25=0.07200, 50=0.06480, 100=0.04760, 250=0.03460, 500=0.03170, 1000=0.02738 (USD); Case/Package: 0603; Number of Pins: 2; Core Material: Ferrite; Case Code (Metric): 1608; Case Code (Imperial): 0603; Min Operating Temperature: -55°C; Max Operating Temperature: 125°C; Tolerance: 25%; Max DC Current: 500mA; Package Quantity: 1; Max Current Rating: 500mA; Packaging: Tape and Reel; Current Rating: 500mA; Termination: SMD/SMT; DC Current: 500mA; Frequency: 100MHz; Number of Circuits: 1; Series: BLM18A; DC Resistance-Max: 180mR; Length: 1.6mm; Width: 0.8mm; Height: 0.8mm; Depth: 0.8mm; Radiation Hardening: No; REACH SVHC: No SVHC; Military Standard: Not; Lead Free: Lead Free; RoHS Compliant: Yes; ComponentLink1URL: https://datasheet.ciiva.com/11795/0900766b811b5866-11795382.pdf?src-supplier=RSComponents; ComponentLink1Description: https://datasheet.ciiva.com/11795/0900766b811b5866-11795382.pdf?src-supplier=RSComponents; ComponentLink2URL: https://datasheet.ciiva.com/19460/1844723-19460204.pdf?src-supplier=Jameco; ComponentLink2Description: https://datasheet.ciiva.com/19460/1844723-19460204.pdf?src-supplier=Jameco; ComponentLink3URL: https://datasheet.ciiva.com/29347/442268-da-01-en-chip-drossel-0603-120r-500ma-1-6x0-8mm-29347890.pdf?src-supplier=Conrad; ComponentLink3Description: https://datasheet.ciiva.com/29347/442268-da-01-en-chip-drossel-0603-120r-500ma-1-6x0-8mm-29347890.pdf?src-supplier=Conrad; ComponentLink4URL: https://datasheet.ciiva.com/41449/001172222-da-01-en-drossel-0603-120r-1-6x0-8mm-4000st-41449509.pdf?src-supplier=Conrad; ComponentLink4Description: https://datasheet.ciiva.com/41449/001172222-da-01-en-drossel-0603-120r-1-6x0-8mm-4000st-41449509.pdf?src-supplier=Conrad; ComponentLink5URL: https://datasheet.ciiva.com/14122/blm-series-eng-tds-14122902.pdf?src-supplier=Distrelec; ComponentLink5Description: https://datasheet.ciiva.com/14122/blm-series-eng-tds-14122902.pdf?src-supplier=Distrelec; ComponentLink6URL: https://datasheet.ciiva.com/17246/l0110s0100blm18a-17246919.pdf?src-supplier=Avnet+Europe; ComponentLink6Description: https://datasheet.ciiva.com/17246/l0110s0100blm18a-17246919.pdf?src-supplier=Avnet+Europe; ComponentLink7URL: https://datasheet.ciiva.com/3081/l0110s0100blm18a-3081610.pdf?src-supplier=Avnet; ComponentLink7Description: https://datasheet.ciiva.com/3081/l0110s0100blm18a-3081610.pdf?src-supplier=Avnet; ComponentLink8URL: https://datasheet.ciiva.com/1012/l0110s0100blm18a-1012011.pdf?src-supplier=Digi-Key; ComponentLink8Description: https://datasheet.ciiva.com/1012/l0110s0100blm18a-1012011.pdf?src-supplier=Digi-Key; ComponentLink9URL: https://datasheet.ciiva.com/1012/l0110s0100blm18a-1012012.pdf?src-supplier=Digi-Key; ComponentLink9Description: https://datasheet.ciiva.com/1012/l0110s0100blm18a-1012012.pdf?src-supplier=Digi-Key; ComponentLink10URL: https://datasheet.ciiva.com/8510/l0110s0100blm18a-8510156.pdf?src-supplier=Avnet; ComponentLink10Description: https://datasheet.ciiva.com/8510/l0110s0100blm18a-8510156.pdf?src-supplier=Avnet; ComponentLink11URL: https://datasheet.ciiva.com/1012/l0110s0100blm18a-1012013.pdf?src-supplier=Digi-Key; ComponentLink11Description: https://datasheet.ciiva.com/1012/l0110s0100blm18a-1012013.pdf?src-supplier=Digi-Key; ComponentLink12URL: https://datasheet.ciiva.com/16215/l0110s0100blm18a-16215230.pdf?src-supplier=Future+Electronics; ComponentLink12Description: https://datasheet.ciiva.com/16215/l0110s0100blm18a-16215230.pdf?src-supplier=Future+Electronics; Supplier Part Number 1: 490-1011-1-ND
R10 R12 = RC0603JR-0747KL: RES SMD 47K OHM 5% 1/10W 0603; Manufacturer: Yageo; Resistance: 47kR; Power Rating: 100mW; Voltage Rating (DC): 50V; Temperature Coefficient: 100ppm/°C; Supplier 1: Arrow; Manufacturer Part Number: RC0603JR-0747KL; Stock 1: 599135; Pricing 1: 5000=0.0025, 10000=0.0022, 25000=0.0019, 1=0.0011, 6000=0.001 (USD); Case/Package: 0603; Number of Pins: 2; Case Code (Imperial): 0603; Case Code (Metric): 1608; Min Operating Temperature: -55°C; Max Operating Temperature: 155°C; Packaging: Tape and Reel; Tolerance: 5%; Voltage Rating: 50V; Package Quantity: 5000; Termination: SMD/SMT; Military Standard: Not; Composition: Thick Film; Length: 1.6mm; Height: 0.45mm; Width: 0.8mm; Depth: 0.8mm; REACH SVHC: No SVHC; Lead Free: Lead Free; ComponentLink1URL: http://www.farnell.com/datasheets/443971.pdf; ComponentLink1Description: http://www.farnell.com/datasheets/443971.pdf; ComponentLink2URL: http://www.mouser.com/catalog/specsheets/RC0603.pdf; ComponentLink2Description: http://www.mouser.com/catalog/specsheets/RC0603.pdf; Supplier Part Number 1: RC0603JR-0747KL
R11 = RC0805FR-070RL: Res Thick Film 0805 0 Ohm Epoxy Pad SMD T/R; Manufacturer: Yageo; Resistance: 0mR; Tolerance: 1%; Power Rating: 125mW; Supplier 1: Avnet; Manufacturer Part Number: RC0805FR-070RL; RoHS: Yes; Category: Chip SMD Resistors; Stock 1: 320000; Pricing 1: 5000=0.00285, 10000=0.00281, 20000=0.00273, 30000=0.00267, 40000=0.00257, 50000=0.00251, 500000=0.00245 (USD); Case/Package: 0805; Contact Plating: Tin,Matte; Case Code (Imperial): 0805; Case Code (Metric): 2012; Size Code: 0805; Min Operating Temperature: -55°C; Max Operating Temperature: 155°C; Resistor Type: Thick Film; Packaging: Tape and Reel; Features: Moisture Resistant; Series: RC; Max Power Dissipation: 125mW; Number of Terminations: 2; Construction: Rectangular; Length: 2mm; Depth: 1.25mm; Radiation Hardening: No; Military Standard: Not; Lead Free: Lead Free; RoHS Compliant: Yes; ComponentLink1URL: https://datasheet.ciiva.com/17042/rc0805-17042698.pdf?src-supplier=Future+Electronics; ComponentLink1Description: https://datasheet.ciiva.com/17042/rc0805-17042698.pdf?src-supplier=Future+Electronics; ComponentLink2URL: https://datasheet.ciiva.com/15189/getdatasheetpartid-348154-15189885.pdf?src-supplier=Verical; ComponentLink2Description: https://datasheet.ciiva.com/15189/getdatasheetpartid-348154-15189885.pdf?src-supplier=Verical; Supplier Part Number 1: RC0805FR-070RL
U5 = HT8693: Class D, Class AB 1-Channel (Mono) 11W x 1 @ 4Ω, 9W x 1 @ 4Ω 3V ~ 9V SOP-8_EP_150mil Audio Power OpAmps RoHS; Voltage - Supply: 3V ~ 9Vv; Package: SOP-8_EP_150mil; Manufacturer: Manufacturer; Type: Class D, Class AB; Output Type: 1-Channel (Mono); Max Output Power x Channels @ Load: 11W x 1 @ 4Ω, 9W x 1 @ 4Ω; Features: Overcurrent Protection, Thermal, Undervoltage Protection

## Sheet Power_Section.SchDoc
size A4
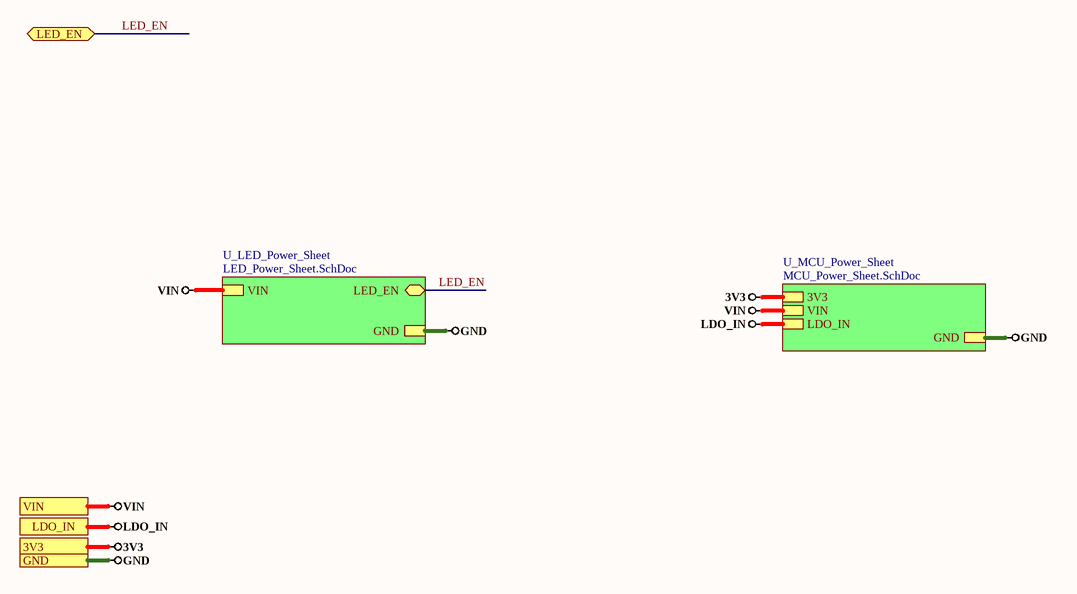
[diagram p4: Power_Section.SchDoc]

### Sub-sheets
U_LED_Power_Sheet = LED_Power_Sheet.SchDoc: GND, VIN, LED_EN (bidir)
U_MCU_Power_Sheet = MCU_Power_Sheet.SchDoc: 3V3, GND, LDO_IN, VIN

### Ports
3V3, GND, LDO_IN, LED_EN (bidir), VIN

### Nets
3V3: port 3V3, sheet U_MCU_Power_Sheet/3V3
GND: port GND, sheet U_MCU_Power_Sheet/GND, sheet U_LED_Power_Sheet/GND
LDO_IN: port LDO_IN, sheet U_MCU_Power_Sheet/LDO_IN
VIN: port VIN, sheet U_MCU_Power_Sheet/VIN, sheet U_LED_Power_Sheet/VIN
LED_EN: port LED_EN, sheet U_LED_Power_Sheet/LED_EN